# Altium schematic sheet Main.SchDoc
size A4; SheetNumber: 1; SheetTotal: 12
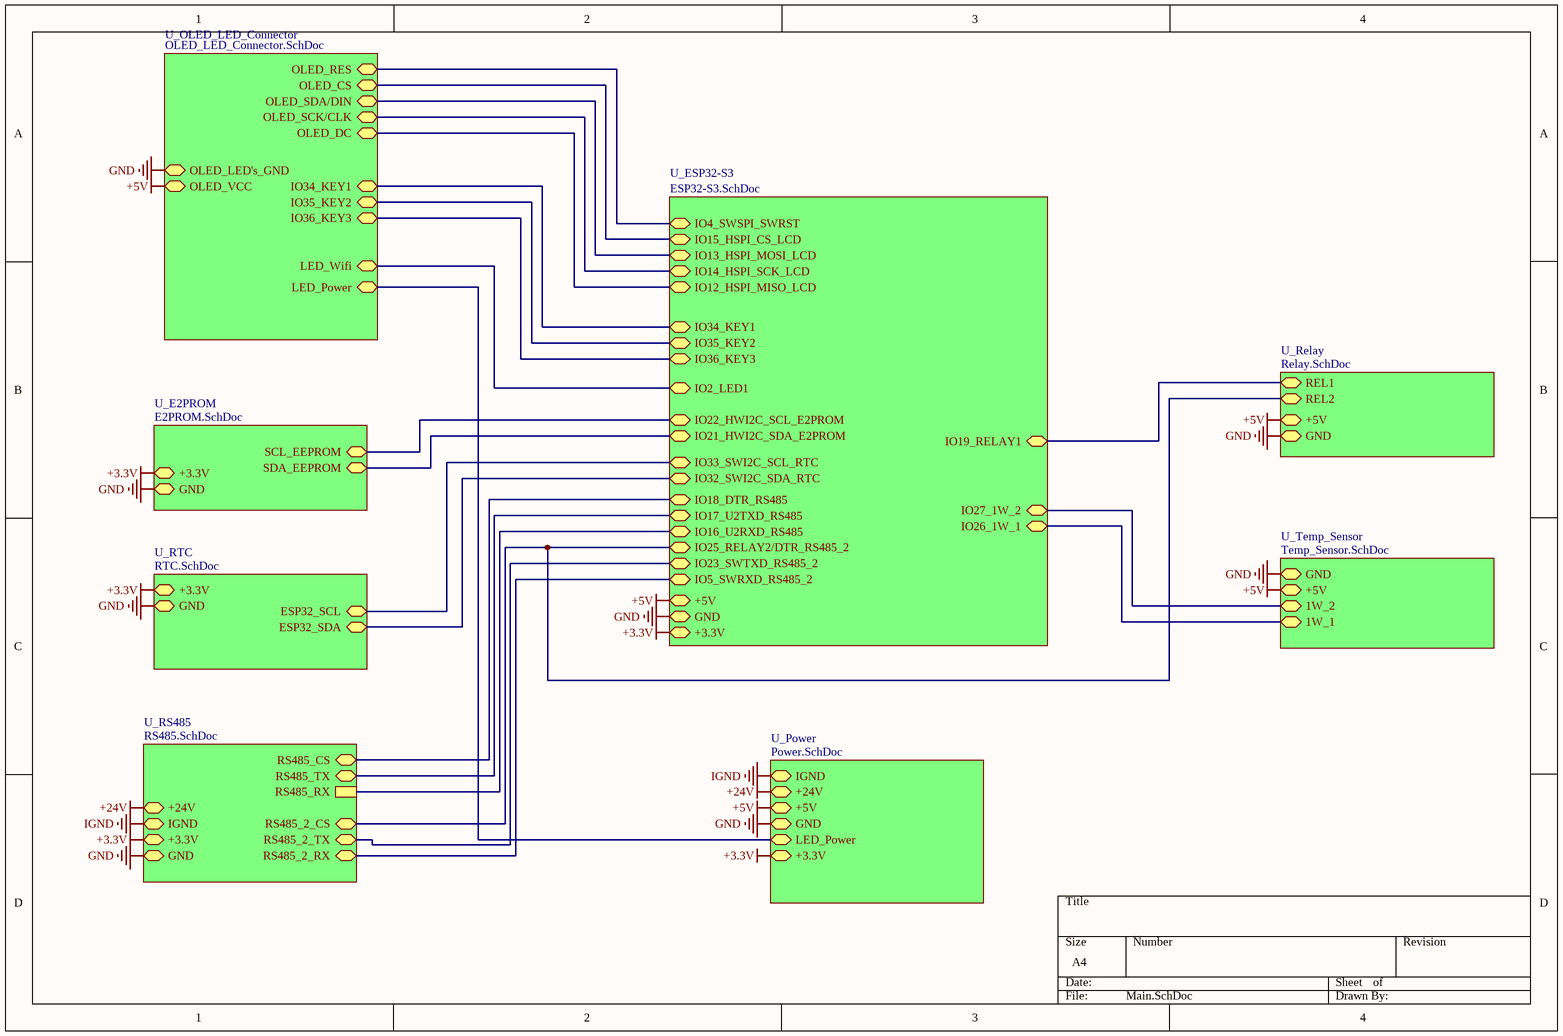
[diagram p0: Main.SchDoc]

## Sub-sheets
U_E2PROM = E2PROM.SchDoc: SCL_EEPROM (bidir), SDA_EEPROM (bidir), +3.3V (bidir), GND (bidir)
U_ESP32-S3 = ESP32-S3.SchDoc: IO18_DTR_RS485 (bidir), IO17_U2TXD_RS485 (bidir), IO16_U2RXD_RS485 (bidir), IO22_HWI2C_SCL_E2PROM (bidir), IO21_HWI2C_SDA_E2PROM (bidir), IO32_SWI2C_SDA_RTC (bidir), IO4_SWSPI_SWRST (bidir), IO15_HSPI_CS_LCD (bidir), IO13_HSPI_MOSI_LCD (bidir), IO14_HSPI_SCK_LCD (bidir), IO33_SWI2C_SCL_RTC (bidir), IO2_LED1 (bidir), IO35_KEY2 (bidir), IO36_KEY3 (bidir), IO34_KEY1 (bidir), IO12_HSPI_MISO_LCD (bidir), IO19_RELAY1 (bidir), IO26_1W_1 (bidir), IO27_1W_2 (bidir), +3.3V (bidir), GND (bidir), +5V (bidir), IO25_RELAY2/DTR_RS485_2 (bidir), IO23_SWTXD_RS485_2 (bidir), IO5_SWRXD_RS485_2 (bidir)
U_OLED_LED_Connector = OLED_LED_Connector.SchDoc: OLED_LED's_GND (bidir), OLED_VCC (bidir), OLED_SCK/CLK (bidir), OLED_SDA/DIN (bidir), OLED_RES (bidir), OLED_DC (bidir), OLED_CS (bidir), LED_Power (bidir), LED_Wifi (bidir), IO34_KEY1 (bidir), IO35_KEY2 (bidir), IO36_KEY3 (bidir)
U_Power = Power.SchDoc: IGND (bidir), +24V (bidir), +5V (bidir), GND (bidir), LED_Power (bidir), +3.3V (bidir)
U_Relay = Relay.SchDoc: REL1 (bidir), REL2 (bidir), +5V (bidir), GND (bidir)
U_RS485 = RS485.SchDoc: RS485_CS (bidir), RS485_TX (bidir), RS485_RX, +24V (bidir), IGND (bidir), +3.3V (bidir), GND (bidir), RS485_2_TX (bidir), RS485_2_RX (bidir), RS485_2_CS (bidir)
U_RTC = RTC.SchDoc: +3.3V (bidir), GND (bidir), ESP32_SDA (bidir), ESP32_SCL (bidir)
U_Temp_Sensor = Temp_Sensor.SchDoc: GND (bidir), +5V (bidir), 1W_2 (bidir), 1W_1 (bidir)

## Nets
+3.3V: sheet U_E2PROM/+3.3V, sheet U_Power/+3.3V, sheet U_RS485/+3.3V, sheet U_RTC/+3.3V, sheet U_ESP32-S3/+3.3V
+5V: sheet U_Power/+5V, sheet U_Relay/+5V, sheet U_Temp_Sensor/+5V, sheet U_OLED_LED_Connector/OLED_VCC, sheet U_ESP32-S3/+5V
+24V: sheet U_Power/+24V, sheet U_RS485/+24V
GND: sheet U_E2PROM/GND, sheet U_Power/GND, sheet U_Relay/GND, sheet U_RS485/GND, sheet U_RTC/GND, sheet U_Temp_Sensor/GND, sheet U_OLED_LED_Connector/OLED_LED's_GND, sheet U_ESP32-S3/GND
IGND: sheet U_Power/IGND, sheet U_RS485/IGND
(unnamed): sheet U_E2PROM/SCL_EEPROM, sheet U_ESP32-S3/IO22_HWI2C_SCL_E2PROM
(unnamed): sheet U_E2PROM/SDA_EEPROM, sheet U_ESP32-S3/IO21_HWI2C_SDA_E2PROM
(unnamed): sheet U_Power/LED_Power, sheet U_OLED_LED_Connector/LED_Power
(unnamed): sheet U_Relay/REL1, sheet U_ESP32-S3/IO19_RELAY1
(unnamed): sheet U_Relay/REL2, sheet U_RS485/RS485_2_CS, sheet U_ESP32-S3/IO25_RELAY2/DTR_RS485_2
(unnamed): sheet U_RS485/RS485_CS, sheet U_ESP32-S3/IO18_DTR_RS485
(unnamed): sheet U_RS485/RS485_TX, sheet U_ESP32-S3/IO17_U2TXD_RS485
(unnamed): sheet U_RS485/RS485_RX, sheet U_ESP32-S3/IO16_U2RXD_RS485
(unnamed): sheet U_RS485/RS485_2_TX, sheet U_ESP32-S3/IO23_SWTXD_RS485_2
(unnamed): sheet U_RS485/RS485_2_RX, sheet U_ESP32-S3/IO5_SWRXD_RS485_2
(unnamed): sheet U_RTC/ESP32_SDA, sheet U_ESP32-S3/IO32_SWI2C_SDA_RTC
(unnamed): sheet U_RTC/ESP32_SCL, sheet U_ESP32-S3/IO33_SWI2C_SCL_RTC
(unnamed): sheet U_Temp_Sensor/1W_2, sheet U_ESP32-S3/IO27_1W_2
(unnamed): sheet U_Temp_Sensor/1W_1, sheet U_ESP32-S3/IO26_1W_1
(unnamed): sheet U_OLED_LED_Connector/OLED_SCK/CLK, sheet U_ESP32-S3/IO14_HSPI_SCK_LCD
(unnamed): sheet U_OLED_LED_Connector/OLED_SDA/DIN, sheet U_ESP32-S3/IO13_HSPI_MOSI_LCD
(unnamed): sheet U_OLED_LED_Connector/OLED_RES, sheet U_ESP32-S3/IO4_SWSPI_SWRST
(unnamed): sheet U_OLED_LED_Connector/OLED_DC, sheet U_ESP32-S3/IO12_HSPI_MISO_LCD
(unnamed): sheet U_OLED_LED_Connector/OLED_CS, sheet U_ESP32-S3/IO15_HSPI_CS_LCD
(unnamed): sheet U_OLED_LED_Connector/LED_Wifi, sheet U_ESP32-S3/IO2_LED1
(unnamed): sheet U_OLED_LED_Connector/IO34_KEY1, sheet U_ESP32-S3/IO34_KEY1
(unnamed): sheet U_OLED_LED_Connector/IO35_KEY2, sheet U_ESP32-S3/IO35_KEY2
(unnamed): sheet U_OLED_LED_Connector/IO36_KEY3, sheet U_ESP32-S3/IO36_KEY3